# Altium project Control-Board-v4.0.PrjPcb (part 2 of 2)

## Sheet Controller-Sheet-2.SchDoc
size A4; SheetNumber: 3; SheetTotal: 5
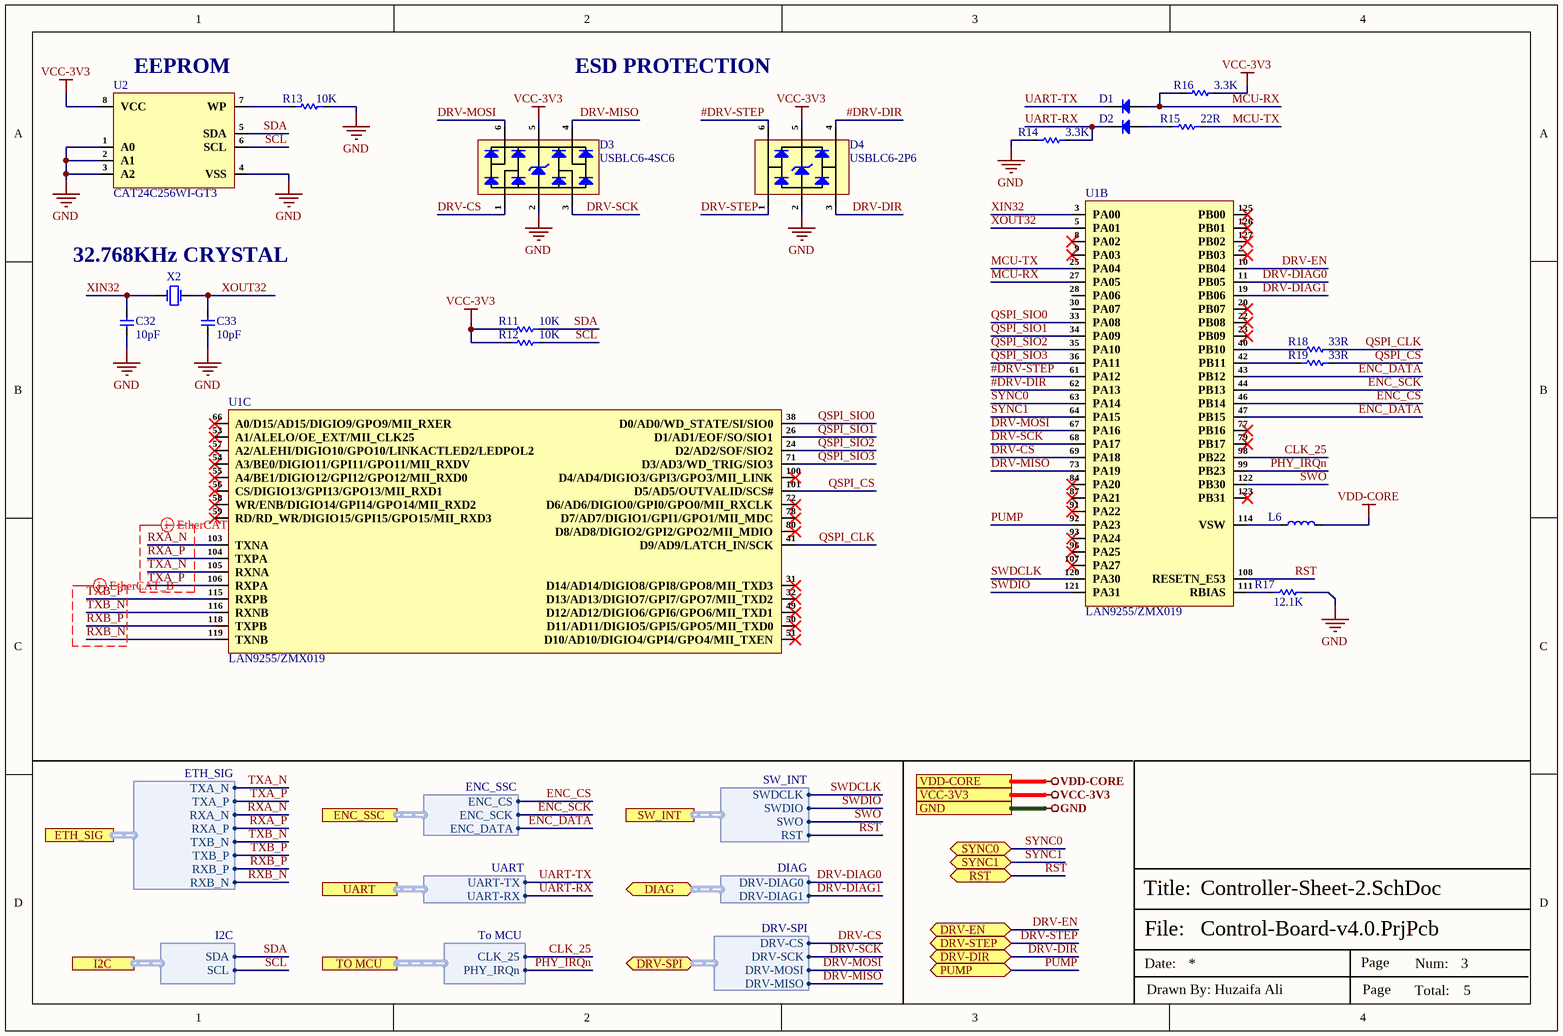
[diagram p2: Controller-Sheet-2.SchDoc]

### Parts
C32  10pF  [CAP-0201]
C33  10pF  [CAP-0201]
D1  1N4148WT  [SOD-523F]  (value not drawn)
D2  1N4148WT  [SOD-523F]  (value not drawn)
D3  USBLC6-4SC6  [SOT-23-6]
D4  USBLC6-2P6  [SOT-666]
L6  MLB1608-201P1A(f)  [IND-0603 (1608 Metric)]  (value not drawn)
R11  10K  [Res-0201]
R12  10K  [Res-0201]
R13  10K  [Res-0201]
R14  3.3K  [Res-0201]
R15  22R  [Res-0201]
R16  3.3K  [Res-0201]
R17  12.1K  [Res-0603]
R18  33R  [Res-0402]
R19  33R  [Res-0402]
U1  LAN9255/ZMX019  [LAN9255/ZMX019]  (parts B,C of 3)
U2  CAT24C256WI-GT3  [CAT24C256WI-GT3]
X2  32.768KHZ  [2-SMD, (2.00mm x 1.20mm)]  (value not drawn)

### Ports
DIAG (bidir, harness DIAG, see Top-Sheet[3B], Connector-Sheet[2D]), DRV-DIR (bidir, see Top-Sheet[3B], Connector-Sheet[1D]), DRV-EN (bidir, see Top-Sheet[3B], Connector-Sheet[1D]), DRV-SPI (bidir, harness DRV-SPI, see Top-Sheet[3B], Connector-Sheet[2D]), DRV-STEP (bidir, see Top-Sheet[3B], Connector-Sheet[1D]), ENC_SSC (harness ENC_SSC, see Top-Sheet[2B], Encoder-Sheet[1D]), ETH_SIG (harness ETH_SIG, see Top-Sheet[3B], Connector-Sheet[1D]), GND (see Top-Sheet[2A], Connector-Sheet[3D], Controller-Sheet-1[2D], Encoder-Sheet[3D]), I2C (harness I2C, see Top-Sheet[2B], Controller-Sheet-1[1D]), PUMP (bidir, see Top-Sheet[3B], Connector-Sheet[1D]), RST (bidir, see Top-Sheet[2B], Connector-Sheet[1D], Controller-Sheet-1[2D]), SW_INT (harness SW_INT, see Top-Sheet[3B], Connector-Sheet[1D]), SYNC0 (bidir, see Top-Sheet[2B], Controller-Sheet-1[2D]), SYNC1 (bidir, see Top-Sheet[2B], Controller-Sheet-1[2D]), TO MCU (harness To MCU, see Top-Sheet[2B], Controller-Sheet-1[1D]), UART (harness UART, see Top-Sheet[3B], Connector-Sheet[2D]), VCC-3V3 (see Top-Sheet[2B], Connector-Sheet[3D], Controller-Sheet-1[2D], Encoder-Sheet[2D]), VDD-CORE (see Top-Sheet[2B], Controller-Sheet-1[3D])

### Harnesses
ETH_SIG: TXA_N, TXA_P, RXA_N, RXA_P, TXB_N, TXB_P, RXB_P, RXB_N
ENC_SSC: ENC_CS, ENC_SCK, ENC_DATA
SW_INT: SWDCLK, SWDIO, SWO, RST
To MCU: CLK_25, PHY_IRQn
UART: UART-TX, UART-RX
I2C: SDA, SCL
DIAG: DRV-DIAG0, DRV-DIAG1
DRV-SPI: DRV-CS, DRV-SCK, DRV-MOSI, DRV-MISO

### Nets
GND: C32.1 C33.1 D3.2(GND) D4.2(GND) R13.2 R14.1 R17.2 U2.1(A0) U2.2(A1) U2.3(A2) U2.4(VSS) ; port GND
VCC-3V3: D3.5(VBUS) D4.5(VBUS) R11.1 R12.1 R16.2 U2.8(VCC) ; port VCC-3V3
VDD-CORE: L6.2 ; port VDD-CORE
#DRV-DIR: D4.4(I/O3) U1.62(PA13)
#DRV-STEP: D4.6(I/O4) U1.61(PA12)
CLK_25: U1.98(PB22) ; port TO MCU.CLK_25
DRV-CS: D3.1(I/O1) U1.69(PA18) ; port DRV-SPI.DRV-CS
DRV-DIAG0: U1.11(PB05) ; port DIAG.DRV-DIAG0
DRV-DIAG1: U1.19(PB06) ; port DIAG.DRV-DIAG1
DRV-DIR: D4.3(I/O2) ; port DRV-DIR
DRV-EN: U1.10(PB04) ; port DRV-EN
DRV-MISO: D3.4(I/O3) U1.73(PA19) ; port DRV-SPI.DRV-MISO
DRV-MOSI: D3.6(I/O4) U1.67(PA16) ; port DRV-SPI.DRV-MOSI
DRV-SCK: D3.3(I/O2) U1.68(PA17) ; port DRV-SPI.DRV-SCK
DRV-STEP: D4.1(I/O1) ; port DRV-STEP
ENC_CS: U1.46(PB14) ; port ENC_SSC.ENC_CS
ENC_DATA: U1.43(PB12) U1.47(PB15) ; port ENC_SSC.ENC_DATA
ENC_SCK: U1.44(PB13) ; port ENC_SSC.ENC_SCK
MCU-RX: D1.1(A) R16.1 U1.27(PA05)
MCU-TX: R15.2 U1.25(PA04)
PHY_IRQn: U1.99(PB23) ; port TO MCU.PHY_IRQn
PUMP: U1.92(PA23) ; port PUMP
QSPI_CLK: R18.2 U1.41(D9/AD9/LATCH_IN/SCK)
QSPI_CS: R19.2 U1.101(D5/AD5/OUTVALID/SCS#)
QSPI_SIO0: U1.33(PA08) U1.38(D0/AD0/WD_STATE/SI/SIO0)
QSPI_SIO1: U1.26(D1/AD1/EOF/SO/SIO1) U1.34(PA09)
QSPI_SIO2: U1.24(D2/AD2/SOF/SIO2) U1.35(PA10)
QSPI_SIO3: U1.36(PA11) U1.71(D3/AD3/WD_TRIG/SIO3)
RST: U1.108(RESETN_E53) ; port RST, port SW_INT.RST
RXA_N: U1.103(TXNA) ; port ETH_SIG.RXA_N
RXA_P: U1.104(TXPA) ; port ETH_SIG.RXA_P
RXB_N: U1.119(TXNB) ; port ETH_SIG.RXB_N
RXB_P: U1.118(TXPB) ; port ETH_SIG.RXB_P
SCL: R12.2 U2.6(SCL) ; port I2C.SCL
SDA: R11.2 U2.5(SDA) ; port I2C.SDA
SWDCLK: U1.120(PA30) ; port SW_INT.SWDCLK
SWDIO: U1.121(PA31) ; port SW_INT.SWDIO
SWO: U1.122(PB30) ; port SW_INT.SWO
SYNC0: U1.63(PA14) ; port SYNC0
SYNC1: U1.64(PA15) ; port SYNC1
TXA_N: U1.105(RXNA) ; port ETH_SIG.TXA_N
TXA_P: U1.106(RXPA) ; port ETH_SIG.TXA_P
TXB_N: U1.116(RXNB) ; port ETH_SIG.TXB_N
TXB_P: U1.115(RXPB) ; port ETH_SIG.TXB_P
UART-RX: D2.2(K) R14.2 ; port UART.UART-RX
UART-TX: D1.2(K) ; port UART.UART-TX
XIN32: C32.2 U1.3(PA00) X2.1(OSC1)
XOUT32: C33.2 U1.5(PA01) X2.2(OSC2)
NetD2_1: D2.1(A) R15.1
NetL6_1: L6.1 U1.114(VSW)
NetR13_1: R13.1 U2.7(WP)
NetR17_1: R17.1 U1.111(RBIAS)
NetR18_1: R18.1 U1.40(PB10)
NetR19_1: R19.1 U1.42(PB11)

Not connected (* = marked no-connect by the designer): U1 2(PB03)* 8(PA02)* 9(PA03)* 20(PB07)* 22(PB08)* 23(PB09)* 28(PA06) 30(PA07) 31(D14/AD14/DIGIO8/GPI8/GPO8/MII_TXD3)* 32(D13/AD13/DIGIO7/GPI7/GPO7/MII_TXD2)* 49(D12/AD12/DIGIO6/GPI6/GPO6/MII_TXD1)* 50(D11/AD11/DIGIO5/GPI5/GPO5/MII_TXD0)* 51(D10/AD10/DIGIO4/GPI4/GPO4/MII_TXEN)* 53(A1/ALELO/OE_EXT/MII_CLK25)* 54(A3/BE0/DIGIO11/GPI11/GPO11/MII_RXDV)* 55(A4/BE1/DIGIO12/GPI12/GPO12/MII_RXD0)* 56(CS/DIGIO13/GPI13/GPO13/MII_RXD1)* 57(A2/ALEHI/DIGIO10/GPO10/LINKACTLED2/LEDPOL2)* 58(WR/ENB/DIGIO14/GPI14/GPO14/MII_RXD2)* 59(RD/RD_WR/DIGIO15/GPI15/GPO15/MII_RXD3)* 66(A0/D15/AD15/DIGIO9/GPO9/MII_RXER)* 72(D6/AD6/DIGIO0/GPI0/GPO0/MII_RXCLK)* 77(PB16)* 78(D7/AD7/DIGIO1/GPI1/GPO1/MII_MDC)* 79(PB17)* 80(D8/AD8/DIGIO2/GPI2/GPO2/MII_MDIO)* 84(PA20)* 87(PA21)* 91(PA22)* 93(PA24)* 96(PA25)* 100(D4/AD4/DIGIO3/GPI3/GPO3/MII_LINK)* 107(PA27)* 123(PB31)* 125(PB00)* 126(PB01)* 127(PB02)*

### Layout directives
differential pair; differential pair class EtherCAT_B_Lines; net class EtherCAT_B; rule Matched Net Lengths [Tolerance = 25.4mil]; rule Impedance Constraint [Min = 85.00    Max = 95.00    ]: RXB_N, RXB_P, TXB_N, TXB_P
differential pair; differential pair class EtherCAT_A_Lines; net class EtherCAT_A; rule Matched Net Lengths [Tolerance = 25.4mil]; rule Impedance Constraint [Min = 85.00    Max = 95.00    ]: RXA_N, RXA_P, TXA_N, TXA_P

### Notes on the sheet
- (near U2) EEPROM
- ESD PROTECTION
- (near X2) 32.768KHz CRYSTAL
- File:
- Title:
- Date:
- Page
- Num:
- Total:
- Drawn By: Huzaifa Ali

### Library data of the parts
C32 C33 = CGA1A2C0G1E100D030BA: CAP CER 10PF 25V C0G 0201; Manufacturer: TDK; Item Type: Capacitor; Supplier 1: Digi-Key; Manufacturer Part Number: CGA1A2C0G1E100D030BA; RoHS: Yes; Category: Ceramic Capacitors; Stock 1: 28695; Pricing 1: 1=0.11000, 10=0.07900, 50=0.04340, 100=0.03540, 500=0.02530, 1000=0.01987, 2500=0.01807, 5000=0.01662 (USD); Mount: Surface Mount; Case/Package: 0201; Case Code (Imperial): 0201; Case Code (Metric): 0603; Weight: 6E-06oz; Min Operating Temperature: -55°C; Max Operating Temperature: 125°C; Packaging: Tape and Reel; Capacitance: 10pF; Voltage Rating: 25V; Termination: SMD/SMT; Voltage Rating (DC): 25V; Package Quantity: 1; Dielectric: C0G; Resistor Type: Ceramic; Series: CGA; Length: 0.6mm; Width: 0.3mm; Height: 0.3mm; Thickness: 0.013inch; Depth: 0.3mm; Ratings: AEC-Q200; RoHS Compliant: Yes; ComponentLink1URL: https://datasheet.ciiva.com/24220/cga1a2c0g1e100d030ba-271838-24220873.pdf?src-supplier=Mouser; ComponentLink1Description: https://datasheet.ciiva.com/24220/cga1a2c0g1e100d030ba-271838-24220873.pdf?src-supplier=Mouser; Supplier Part Number 1: 445-9023-1-ND; LCSC Part Number: C2168728
D1 D2 = 1N4148WT: DIODE GEN PURP 75V 200MA SOD523F; Manufacturer: ON Semiconductor / Fairchild; Recovery Time: 4ns; Forward Current: 300mA; Max Reverse Current: 5uA; Power Dissipation: 200mW; Max Forward Surge Current (Ifsm): 4A; Element Configuration: Single; Supplier 1: Future Electronics; Manufacturer Part Number: 1N4148WT; RoHS: Yes; Category: Rectifier Diodes; Stock 1: 30; Pricing 1: 1=0.0305, 20=0.0267, 125=0.0246, 750=0.0227, 4000=0.0204 (USD); Mounting Technology: Surface Mount; Pins: 2; Weight: 0.01g; Contact Plating: Tin,Matte; Min Operating Temperature: -55°C; Max Operating Temperature: 150°C; Packaging: Tape and Reel; Package Quantity: 1; Series: -; Reverse Recovery Time: 4ns; Max Repetitive Reverse Voltage (Vrrm): 75V; Average Rectified Current: 200mA; Max Reverse Voltage (DC): 75V; Reverse Recovery Time-Max: 4ns; Length: 1.3mm; Width: 0.9mm; Height: 0.7mm; Radiation Hardening: No; RoHS Compliant: Yes; Lead Free: Lead Free; Reach SVHC Compliant: No; ComponentLink1URL: https://datasheet.ciiva.com/16744/1n4148wt-16744972.pdf?src-supplier=Future+Electronics; ComponentLink1Description: https://datasheet.ciiva.com/16744/1n4148wt-16744972.pdf?src-supplier=Future+Electronics; ComponentLink2URL: https://datasheet.ciiva.com/30479/0900766b810e1cd4-30479226.pdf?src-supplier=Rs; ComponentLink2Description: https://datasheet.ciiva.com/30479/0900766b810e1cd4-30479226.pdf?src-supplier=Rs; ComponentLink3URL: https://datasheet.ciiva.com/15208/getdatasheetpartid-146392-15208359.pdf?src-supplier=Verical; ComponentLink3Description: https://datasheet.ciiva.com/15208/getdatasheetpartid-146392-15208359.pdf?src-supplier=Verical; ComponentLink4URL: https://datasheet.ciiva.com/916/1n914bwt-916865.pdf?src-supplier=Digi-Key; ComponentLink4Description: https://datasheet.ciiva.com/916/1n914bwt-916865.pdf?src-supplier=Digi-Key; ComponentLink5URL: https://datasheet.ciiva.com/916/1n914bwt-916866.pdf?src-supplier=Digi-Key; ComponentLink5Description: https://datasheet.ciiva.com/916/1n914bwt-916866.pdf?src-supplier=Digi-Key; ComponentLink6URL: https://datasheet.ciiva.com/916/1n914bwt-916864.pdf?src-supplier=Digi-Key; ComponentLink6Description: https://datasheet.ciiva.com/916/1n914bwt-916864.pdf?src-supplier=Digi-Key; Supplier Part Number 1: 6145918; LCSC Part Number: C232841; Item Type: Diode
D3 = USBLC6-4SC6: TVS DIODE 5.25VWM 17VC SOT23-6; Item Type: ESD Diode; Value: 4pF; Direction: Unidirectional; Reverse Standoff Voltage: 5V; Min Breakdown Voltage: 6V; Power Line Protection: Yes; Peak Pulse Current: 5A; Number of Elements: 1; Operating Supply Voltage: 860mV; Number of Channels: 4; Clamping Voltage: 17V; Polarity: Unidirectional,Bidirectional; Leakage Current: 150nA; Test Current: 1mA; Max Breakdown Voltage: 10V; Max Reverse Leakage Current: 2uA; LCSC Part Number: C111212; ComponentLink1Description: LCSC; Supplier: Mouser; Supplier Part Number: 511-USBLC6-4SC6; RoHS: Yes; Category: TVS Diodes; Stock: 148069; Pricing: 1=0.58, 10=0.512, 50=0.512, 100=0.381, 1000=0.271, 10000=0.211 (USD); Mounting Technology: Surface Mount; Case/Package: SOT-23; Pins: 6; Min Operating Temperature: -40°C; Max Operating Temperature: 125°C; Packaging: Tape and Reel; Series: USB; Reverse Breakdown Voltage: 6V; Breakdown Voltage: 6V; Termination: SMD/SMT; Working Voltage: 5V; ESD Protection: Yes; Voltage Rating (DC): 5V; Clamping Voltage-Max: 17V; Number of Unidirectional Channels: 4; Length: 3.05mm; Width: 1.75mm; Height: 1.3mm; Depth: 1.75mm; Radiation Hardening: No; Lead Free: Lead Free; RoHS Compliant: Yes; Reach SVHC Compliant: No; ComponentLink2URL: https://datasheet.ciiva.com/14186/usblc6-4-st-eng-tds-14186570.pdf?src-supplier=Distrelec; ComponentLink2Description: https://datasheet.ciiva.com/14186/usblc6-4-st-eng-tds-14186570.pdf?src-supplier=Distrelec; ComponentLink3URL: https://datasheet.ciiva.com/27052/1493951-27052291.pdf?src-supplier=Jameco; ComponentLink3Description: https://datasheet.ciiva.com/27052/1493951-27052291.pdf?src-supplier=Jameco; ComponentLink4URL: https://datasheet.ciiva.com/1220/48344-1220005.pdf?src-supplier=Newark; ComponentLink4Description: https://datasheet.ciiva.com/1220/48344-1220005.pdf?src-supplier=Newark; ComponentLink5URL: https://datasheet.ciiva.com/4507/cd00047494-112581-4507757.pdf?src-supplier=Mouser; ComponentLink5Description: https://datasheet.ciiva.com/4507/cd00047494-112581-4507757.pdf?src-supplier=Mouser; ComponentLink6URL: https://datasheet.ciiva.com/16206/cd00047494-16206119.pdf?src-supplier=Future+Electronics; ComponentLink6Description: https://datasheet.ciiva.com/16206/cd00047494-16206119.pdf?src-supplier=Future+Electronics; ComponentLink7URL: https://datasheet.ciiva.com/15143/getdatasheetpartid-88767-15143364.pdf?src-supplier=Verical; ComponentLink7Description: https://datasheet.ciiva.com/15143/getdatasheetpartid-88767-15143364.pdf?src-supplier=Verical; ComponentLink8URL: https://datasheet.ciiva.com/22685/1498406-22685833.pdf?src-supplier=Element14; ComponentLink8Description: https://datasheet.ciiva.com/22685/1498406-22685833.pdf?src-supplier=Element14; ComponentLink9URL: https://datasheet.ciiva.com/22692/1498406-22692454.pdf?src-supplier=Element14; ComponentLink9Description: https://datasheet.ciiva.com/22692/1498406-22692454.pdf?src-supplier=Element14
D4 = USBLC6-2P6: TVS DIODE 5.25VWM 17VC SOT666; Item Type: ESD Diode; Direction: Unidirectional,Bidirectional; Operating Supply Voltage: 5V; Number of Elements: 1; Value: 3.5pF; Reverse Breakdown Voltage: 6V; Number of Channels: 2; Clamping Voltage: 17V; Power Line Protection: Yes; Test Current: 1mA; Max Reverse Leakage Current: 150nA; Peak Pulse Current: 5A; Max Repetitive Reverse Voltage (Vrrm): 5.25V; LCSC Part Number: C15999; ComponentLink1Description: LCSC; Supplier: Mouser; Supplier Part Number: 511-USBLC6-2P6; RoHS: Yes; Category: TVS Diodes; Stock: 180020; Pricing: 1=0.59, 10=0.514, 50=0.514, 100=0.356, 1000=0.253, 10000=0.197 (USD); Mounting Technology: Surface Mount; Case/Package: SOT-666; Pins: 6; Min Operating Temperature: -40°C; Max Operating Temperature: 125°C; Package Quantity: 1; Packaging: Tape and Reel; Number of Bidirectional Channels: 2; Reverse Standoff Voltage: 5V; Min Breakdown Voltage: 6V; Polarity: Unidirectional,Bidirectional; Breakdown Voltage: 6V; Termination: SMD/SMT; Working Voltage: 5V; ESD Protection: Yes; Leakage Current: 150nA; Max Breakdown Voltage: 6V; Series: USB; Clamping Voltage-Max: 17V; Number of Unidirectional Channels: 2; Length: 1.7mm; Width: 1.3mm; Height: 0.6mm; Depth: 1.3mm; Radiation Hardening: No; Reach SVHC Compliant: No; Lead Free: Lead Free; RoHS Compliant: Yes; ComponentLink2URL: https://datasheet.ciiva.com/14186/usblc6-2-st-eng-tds-14186568.pdf?src-supplier=Distrelec; ComponentLink2Description: https://datasheet.ciiva.com/14186/usblc6-2-st-eng-tds-14186568.pdf?src-supplier=Distrelec; ComponentLink3URL: https://datasheet.ciiva.com/15143/getdatasheetpartid-98673-15143462.pdf?src-supplier=Verical; ComponentLink3Description: https://datasheet.ciiva.com/15143/getdatasheetpartid-98673-15143462.pdf?src-supplier=Verical; ComponentLink4URL: https://datasheet.ciiva.com/22685/1690354-22685832.pdf?src-supplier=Element14; ComponentLink4Description: https://datasheet.ciiva.com/22685/1690354-22685832.pdf?src-supplier=Element14; ComponentLink5URL: https://datasheet.ciiva.com/22692/1690354-22692453.pdf?src-supplier=Element14; ComponentLink5Description: https://datasheet.ciiva.com/22692/1690354-22692453.pdf?src-supplier=Element14; ComponentLink6URL: https://datasheet.ciiva.com/4508/cd00050750-4508892.pdf?src-supplier=Mouser; ComponentLink6Description: https://datasheet.ciiva.com/4508/cd00050750-4508892.pdf?src-supplier=Mouser; ComponentLink7URL: https://datasheet.ciiva.com/16378/cd00050750-16378714.pdf?src-supplier=Future+Electronics; ComponentLink7Description: https://datasheet.ciiva.com/16378/cd00050750-16378714.pdf?src-supplier=Future+Electronics; ComponentLink8URL: https://datasheet.ciiva.com/41444/001184108-da-01-en-ic-esd-protection-usblc6-2p6-sot-666-stm-41444134.pdf?src-supplier=Conrad; ComponentLink8Description: https://datasheet.ciiva.com/41444/001184108-da-01-en-ic-esd-protection-usblc6-2p6-sot-666-stm-41444134.pdf?src-supplier=Conrad
L6 = MLB1608-201P1A(f): 200Ω @ 100MHz 1 1A 300mΩ 0603 Ferrite Beads; Manufacturer: Meled; Number of Lines: 1; Impedance @ Frequency: 200Ω @ 100MHz; Current Rating (Max): 1A; DC Resistance (DCR) (Max): 300mΩ; ComponentLink1Description: LCSC; ComponentLink1URL: https://www.lcsc.com/product-detail/Ferrite-Beads_Meled-MLB1608-201P1A-f_C45316.html
R11-R13 = RC0201FR-0710KL: RES SMD 10K OHM 1% 1/20W 0201; Manufacturer: Yageo; Item Type: Resistor; Manufacturer Part Number: RC0201FR-0710KL; Package: 0201; ComponentLink7Description: LCSC; ComponentLink7URL: https://www.lcsc.com/product-detail/Chip-Resistor-Surface-Mount_YAGEO-RC0201FR-0710KL_C106225.html; LCSC Part Number: C106225
R14 R16 = RC0201FR-073K3L: RES 3.3K OHM 1% 1/20W 0201; Manufacturer: Yageo; Item Type: Resistor; Supplier: Future Electronics; Supplier Part Number: 1068525; Manufacturer Part Number: RC0201FR-073K3L; RoHS: Yes; Category: Chip SMD Resistors; Stock: 40000; Pricing: 10000=0.0009, 50000=0.0013, 100000=0.0008, 250000=0.0013, 400000=0.0008, 750000=0.0012, 1500000=0.0007, 2000000=0.0011, 5000000=0.0007 (USD); ComponentLink1URL: https://datasheet.ciiva.com/14985/pyu-r-int-thick-7-14985418.pdf?src-supplier=Digi-Key; ComponentLink1Description: https://datasheet.ciiva.com/14985/pyu-r-int-thick-7-14985418.pdf?src-supplier=Digi-Key; ComponentLink2URL: https://datasheet.ciiva.com/22698/1563626-22698524.pdf?src-supplier=Element14; ComponentLink2Description: https://datasheet.ciiva.com/22698/1563626-22698524.pdf?src-supplier=Element14; LCSC Part Number: C274874
R15 = RC0201FR-0722RL: RES 22 OHM 1% 1/20W 0201; Manufacturer: Yageo; Item Type: Resistor; Supplier: Future Electronics; Supplier Part Number: 5973409; Manufacturer Part Number: RC0201FR-0722RL; RoHS: Yes; Category: Chip SMD Resistors; Stock: 17980000; Pricing: 10000=0.0014, 50000=0.0013, 250000=0.0013, 750000=0.0012, 2000000=0.0011 (USD); ComponentLink1URL: https://datasheet.ciiva.com/7672/1563626-7672215.pdf?src-supplier=Element14; ComponentLink1Description: https://datasheet.ciiva.com/7672/1563626-7672215.pdf?src-supplier=Element14; LCSC Part Number: C155743
R17 = RT0603CRD0712K1L: RES SMD 12.1K OHM 1/10W 0603; Manufacturer: Yageo; Resistance: 12.1kR; Tolerance: 0.25%; Temperature Coefficient: 25ppm/°C; Power Rating: 100mW; Voltage Rating: 75V; Voltage Rating (DC): 50V; Supplier 1: Digi-Key; Manufacturer Part Number: RT0603CRD0712K1L; RoHS: Yes; Category: Chip SMD Resistors; Pricing 1: 5000=0.06299 (USD); Case/Package: 0603; Contact Plating: Tin,Matte; Case Code (Metric): 1608; Case Code (Imperial): 0603; Min Operating Temperature: -55°C; Max Operating Temperature: 125°C; Resistor Type: Thin Film; Package Quantity: 5000; Packaging: Tape and Reel; Number of Terminations: 2; Termination: SMD/SMT; Max Power Dissipation: 100mW; Series: RT; Length: 0.063inch; Width: 0.031inch; Height: 0.022inch; Radiation Hardening: No; Lead Free: Lead Free; RoHS Compliant: Yes; ComponentLink1URL: https://datasheet.ciiva.com/2590/pyu-rt-1-to-0-05-rohs-l-5-2590806.pdf?src-supplier=Digi-Key; ComponentLink1Description: https://datasheet.ciiva.com/2590/pyu-rt-1-to-0-05-rohs-l-5-2590806.pdf?src-supplier=Digi-Key; ComponentLink2URL: https://datasheet.ciiva.com/8891/pyu-rt-1-to-0-05-rohs-l-4-8891049.pdf?src-supplier=Avnet; ComponentLink2Description: https://datasheet.ciiva.com/8891/pyu-rt-1-to-0-05-rohs-l-4-8891049.pdf?src-supplier=Avnet; ComponentLink3URL: https://datasheet.ciiva.com/12721/pyu-rt-1-to-0-05-rohs-l-4-12721018.pdf?src-supplier=Mouser; ComponentLink3Description: https://datasheet.ciiva.com/12721/pyu-rt-1-to-0-05-rohs-l-4-12721018.pdf?src-supplier=Mouser; Supplier Part Number 1: RT0603CRD0712K1L-ND; LCSC Part Number: C705893
R18 R19 = RC0402FR-0733RL: RES 33 OHM 1% 1/16W 0402; Manufacturer: Yageo; Power Rating: 62.5mW; Voltage Rating: 50V; Temperature Coefficient: 100ppm/°C; Max Power Dissipation: 63mW; Supplier 1: Mouser; Manufacturer Part Number: RC0402FR-0733RL; RoHS: Yes; Category: Chip SMD Resistors; Stock 1: 1843488; Pricing 1: 1=0.10000, 10=0.01200, 50=0.01200, 100=0.00500, 1000=0.00300, 10000=0.00100 (USD); Case/Package: 0402; Number of Pins: 2; Case Code (Imperial): 0402; Case Code (Metric): 1005; Size Code: 0402; Min Operating Temperature: -55°C; Max Operating Temperature: 155°C; Resistor Type: Thick Film; Resistance: 33R; Tolerance: 1%; Packaging: Tape and Reel; Voltage Rating (DC): 50V; Package Quantity: 10000; Termination: SMD/SMT; Features: Moisture Resistant; Series: RC; Number of Terminations: 2; Resistance Tolerance: 1%; Construction: Rectangular; Technology: THICK FILM; Length: 1mm; Width: 0.5mm; Height: 0.35mm; Depth: 0.5mm; RoHS Compliant: Yes; REACH SVHC: Unknown; Military Standard: Not; Lead Free: Lead Free; ComponentLink1URL: https://datasheet.ciiva.com/11819/0900766b80c66297-11819487.pdf?src-supplier=RSComponents; ComponentLink1Description: https://datasheet.ciiva.com/11819/0900766b80c66297-11819487.pdf?src-supplier=RSComponents; ComponentLink2URL: https://datasheet.ciiva.com/24070/pyu-rc0402-51-rohs-l-6-r-8721-24070077.pdf?src-supplier=Mouser; ComponentLink2Description: https://datasheet.ciiva.com/24070/pyu-rc0402-51-rohs-l-6-r-8721-24070077.pdf?src-supplier=Mouser; ComponentLink3URL: https://datasheet.ciiva.com/7849/1018594-7849967.pdf?src-supplier=Element14; ComponentLink3Description: https://datasheet.ciiva.com/7849/1018594-7849967.pdf?src-supplier=Element14; ComponentLink4URL: https://datasheet.ciiva.com/7849/1018594-7849966.pdf?src-supplier=Element14; ComponentLink4Description: https://datasheet.ciiva.com/7849/1018594-7849966.pdf?src-supplier=Element14; ComponentLink5URL: https://datasheet.ciiva.com/15189/getdatasheetpartid-329253-15189431.pdf?src-supplier=Verical; ComponentLink5Description: https://datasheet.ciiva.com/15189/getdatasheetpartid-329253-15189431.pdf?src-supplier=Verical; ComponentLink6URL: https://datasheet.ciiva.com/17070/pyu-rc0402-51-rohs-l-6-r-17070335.pdf?src-supplier=Future+Electronics; ComponentLink6Description: https://datasheet.ciiva.com/17070/pyu-rc0402-51-rohs-l-6-r-17070335.pdf?src-supplier=Future+Electronics; Supplier Part Number 1: 603-RC0402FR-0733RL; LCSC Part Number: C138002
U1 = LAN9255/ZMX019: IC ETHERCAT SLAVE CONTROLLER; Manufacturer: Microchip; Manufacturer Part Number: LAN9255-I/ZMX019; Supplier 1: Digi-Key; Stock 1: 70; Pricing 1: 1=17.76000, 25=16.18480 (USD); Supplier Part Number 1: 150-LAN9255-I/ZMX019-ND
U2 = CAT24C256WI-GT3: IC EEPROM 256KBIT I2C 1MHZ 8SOIC; Manufacturer: ON Semiconductor; Interface: I2C,Serial,2-Wire; Access Time: 900ns; Max Supply Voltage: 5.5V; Min Supply Voltage: 1.8V; Frequency: 400kHz; Memory Size: 256Kb; Number of Words: 32000; Operating Supply Voltage: 5V; Nominal Supply Current: 3mA; Write Cycle Time-Max (tWC): 5ms; Write Protection: YES; Organization: 32KX8; Supplier 1: RSComponents; Manufacturer Part Number: CAT24C256WI-GT3; RoHS: Yes; Category: EEPROM; Stock 1: 300; Pricing 1: 100=0.19900, 200=0.19400, 500=0.18900, 1000=0.18400 (GBP); Mount: Surface Mount; Case/Package: SOIC; Number of Pins: 8; Contact Plating: Gold; Min Operating Temperature: -40°C; Max Operating Temperature: 85°C; Packaging: Tape and Reel; Density: 256Kb; Package Quantity: 1; Memory Type: EEPROM; Max Frequency: 400kHz; Series: -; Supply Voltage-Nom: 5.5V; Access Time-Max: 900ns; Supply Current: 3mA; Length: 5mm; Width: 4mm; Height: 1.5mm; Radiation Hardening: No; Lead Free: Lead Free; Halogen Free: Halogen Free; REACH SVHC: No SVHC; RoHS Compliant: Yes; ComponentLink1URL: https://datasheet.ciiva.com/8072/1780696-8072142.pdf?src-supplier=Element14; ComponentLink1Description: https://datasheet.ciiva.com/8072/1780696-8072142.pdf?src-supplier=Element14; ComponentLink2URL: https://datasheet.ciiva.com/46391/1792913-46391371.pdf?src-supplier=Element14; ComponentLink2Description: https://datasheet.ciiva.com/46391/1792913-46391371.pdf?src-supplier=Element14; ComponentLink3URL: https://datasheet.ciiva.com/4859/cat24c256-d-105771-4859816.pdf?src-supplier=Mouser; ComponentLink3Description: https://datasheet.ciiva.com/4859/cat24c256-d-105771-4859816.pdf?src-supplier=Mouser; ComponentLink4URL: https://datasheet.ciiva.com/16427/cat24c256-d-16427973.pdf?src-supplier=Future+Electronics; ComponentLink4Description: https://datasheet.ciiva.com/16427/cat24c256-d-16427973.pdf?src-supplier=Future+Electronics; Supplier Part Number 1: 8080199P
X2 = CM8V-T1A-32.768KHZ-6PF-20PPM-TA-QC: Crystal 32.768KHZ 6.0PF SMD; Manufacturer: Micro Crystal; Supplier 1: Digi-Key; Manufacturer Part Number: CM8V-T1A-32.768KHZ-6PF-20PPM-TA-QC; RoHS: No; Stock 1: 21000; Pricing 1: 1=0.68000, 10=0.56400, 50=0.50740, 100=0.45100, 500=0.42844 (USD); Supplier Part Number 1: 2195-CM8V-T1A-32.768KHZ-6PF-20PPM-TA-QCCT-ND

## Sheet Encoder-Sheet.SchDoc
size A4; SheetNumber: 4; SheetTotal: 5
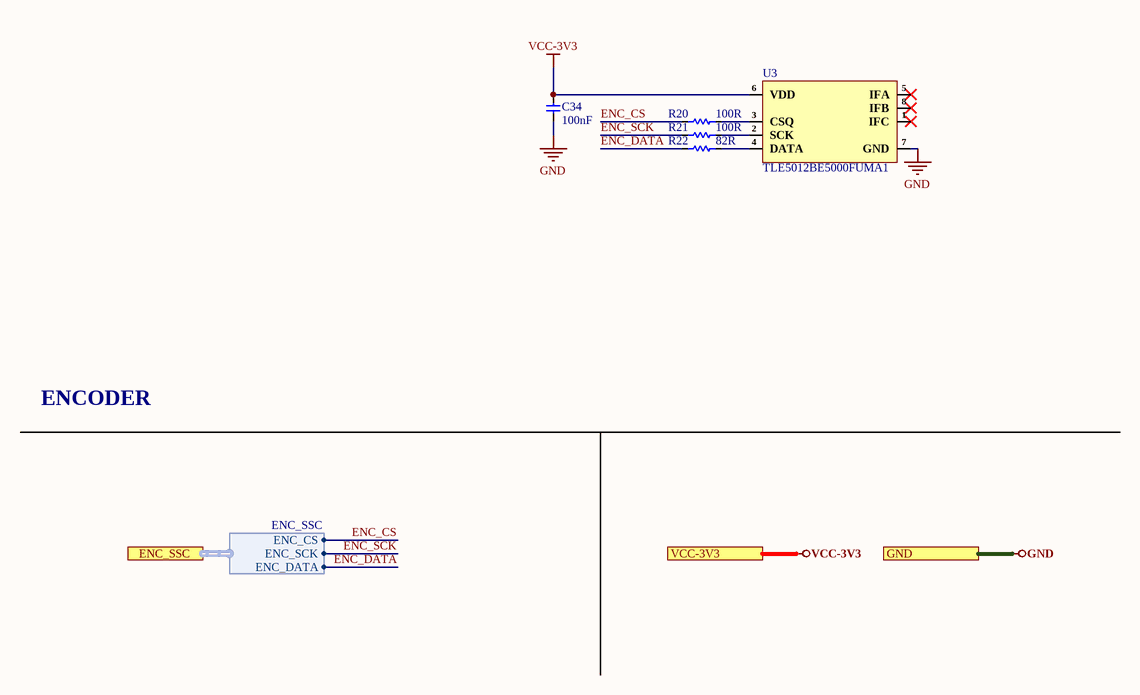
[diagram p3: Encoder-Sheet.SchDoc]

### Parts
C34  100nF  [CAP-0201]
R20  100R  [Res-0201]
R21  100R  [Res-0201]
R22  82R  [Res-0201]
U3  TLE5012BE5000FUMA1  [TLE5012BE5000FUMA1]

### Ports
ENC_SSC (harness ENC_SSC, see Top-Sheet[2C], Controller-Sheet-2[1D]), GND (see Top-Sheet[1C], Connector-Sheet[3D], Controller-Sheet-1[2D], Controller-Sheet-2[3D]), VCC-3V3 (see Top-Sheet[1C], Connector-Sheet[3D], Controller-Sheet-1[2D], Controller-Sheet-2[3D])

### Harnesses
ENC_SSC: ENC_CS, ENC_SCK, ENC_DATA

### Nets
GND: C34.1 U3.7(GND) ; port GND
VCC-3V3: C34.2 U3.6(VDD) ; port VCC-3V3
ENC_CS: R20.1 ; port ENC_SSC.ENC_CS
ENC_DATA: R22.1 ; port ENC_SSC.ENC_DATA
ENC_SCK: R21.1 ; port ENC_SSC.ENC_SCK
NetR20_2: R20.2 U3.3(CSQ)
NetR21_2: R21.2 U3.2(SCK)
NetR22_2: R22.2 U3.4(DATA)

Not connected (* = marked no-connect by the designer): U3 1(IFC)* 5(IFA)* 8(IFB)*

### Notes on the sheet
- ENCODER
- File:
- Title:
- Date:
- Page
- Num:
- Total:
- Drawn By: Huzaifa Ali

### Library data of the parts
C34 = CC0201KRX5R6BB104: CAP CER 0.1UF 10V X5R 0201; Manufacturer: Yageo; Tolerance: 10%; Supplier 1: Mouser; Manufacturer Part Number: CC0201KRX5R6BB104; RoHS: Yes; Category: Ceramic Capacitors; Stock 1: 824403; Pricing 1: 1=0.10000, 10=0.02400, 50=0.02400, 100=0.01900, 1000=0.01100, 10000=0.00900 (USD); Mount: Surface Mount; Case/Package: 0201; Case Code (Imperial): 0201; Case Code (Metric): 0603; Weight: 6E-06oz; Min Operating Temperature: -55°C; Max Operating Temperature: 85°C; Capacitance: 100nF; Dielectric: X5R; Voltage Rating (DC): 10V; Packaging: Tape and Reel; Termination: SMD/SMT; Resistor Type: Ceramic; Voltage Rating: 10V; Series: CC; Construction: Flat; Length: 0.6mm; Width: 0.012inch; Height: 0.3mm; Thickness: 0.013inch; Depth: 0.3mm; Radiation Hardening: No; Lead Free: Lead Free; Halogen Free: Halogen Free; RoHS Compliant: Yes; ComponentLink1URL: https://datasheet.ciiva.com/11587/upy-gphc-x5r-4v-to-50v-12-11587190.pdf?src-supplier=Avnet; ComponentLink1Description: https://datasheet.ciiva.com/11587/upy-gphc-x5r-4v-to-50v-12-11587190.pdf?src-supplier=Avnet; Supplier Part Number 1: 603-CC201KRX5R6BB104; LCSC Part Number: C190183
R20 R21 = RC0201FR-07100RL: RES 100 OHM Thick Film 0201 1% 1/20W ±200ppm/°C Molded SMD SMD Paper T/R; Manufacturer: Yageo; Power Rating: 50mW; Voltage Rating: 25V; Item Type: Resistor; Supplier: Digi-Key; Supplier Part Number: 311-100MCT-ND; Manufacturer Part Number: RC0201FR-07100RL; RoHS: Yes; Category: Chip SMD Resistors; Stock: 193246; Pricing: 1=0.1, 10=0.027, 50=0.0172, 100=0.0143, 500=0.00988, 1000=0.00854, 5000=0.00629 (USD); Case/Package: 0201; Contact Plating: Tin,Matte; Case Code (Metric): 0603; Package: 0201; Min Operating Temperature: -55°C; Max Operating Temperature: 125°C; Value: 100R; Tolerance: 1%; Resistor Type: Thick Film; Temperature Coefficient: 200ppm/°C; Packaging: Cut Tape; Package Quantity: 1; Number of Terminations: 2; Termination: SMD/SMT; Max Power Dissipation: 50mW; Features: Moisture Resistant; Series: RC; Resistance Tolerance: 1%; Length: 0.024inch; Width: 0.012inch; Height: 0.01inch; Lead Free: Lead Free; RoHS Compliant: Yes; Reach SVHC Compliant: Unknown; ComponentLink1URL: https://datasheet.ciiva.com/2560/pyu-r-int-thick-7-2560866.pdf?src-supplier=Digi-Key; ComponentLink1Description: https://datasheet.ciiva.com/2560/pyu-r-int-thick-7-2560866.pdf?src-supplier=Digi-Key; ComponentLink2URL: https://datasheet.ciiva.com/2560/pyu-r-int-thick-7-2560867.pdf?src-supplier=Digi-Key; ComponentLink2Description: https://datasheet.ciiva.com/2560/pyu-r-int-thick-7-2560867.pdf?src-supplier=Digi-Key; ComponentLink3URL: https://datasheet.ciiva.com/2560/pyu-r-int-thick-7-2560865.pdf?src-supplier=Digi-Key; ComponentLink3Description: https://datasheet.ciiva.com/2560/pyu-r-int-thick-7-2560865.pdf?src-supplier=Digi-Key; ComponentLink4URL: https://datasheet.ciiva.com/8887/pyu-rc0201-51-rohs-l-8-8887865.pdf?src-supplier=Avnet; ComponentLink4Description: https://datasheet.ciiva.com/8887/pyu-rc0201-51-rohs-l-8-8887865.pdf?src-supplier=Avnet; LCSC Part Number: C77623; ComponentLink5Description: LCSC; ComponentLink5URL: https://www.lcsc.com/product-detail/Chip-Resistor-Surface-Mount_YAGEO-RC0201FR-07100RL_C77623.html
R22 = RC0201FR-0782RL: RES 82 OHM 0201 Thick Film 1% 0.05W(1/20W) ±200ppm/C Pad SMD T/R; Manufacturer: Yageo; Power Rating: 50mW; Voltage Rating: 25V; Temperature Coefficient: 200ppm/°C; Item Type: Resistor; Supplier: Digi-Key; Supplier Part Number: YAG2818CT-ND; Manufacturer Part Number: RC0201FR-0782RL; RoHS: Yes; Category: Chip SMD Resistors; Stock: 59484; Pricing: 1=0.1, 10=0.027, 50=0.0172, 100=0.0143, 500=0.00988, 1000=0.00854, 5000=0.00629 (USD); Case/Package: 0201; Case Code (Imperial): 0201; Case Code (Metric): 0603; Min Operating Temperature: -55°C; Max Operating Temperature: 125°C; Tolerance: 1%; Value: 82R; Packaging: Tape and Reel; Resistor Type: Thick Film; Number of Terminations: 2; Termination: SMD/SMT; Max Power Dissipation: 50mW; Working Voltage: 25V; Features: Moisture Resistant; Series: RC; Resistance Tolerance: 1%; Technology: THICK FILM; Length: 0.6mm; Width: 0.3mm; Height: 0.23mm; Reach SVHC Compliant: No; Lead Free: Lead Free; RoHS Compliant: Yes; ComponentLink1URL: https://datasheet.ciiva.com/22661/1563626-22661339.pdf?src-supplier=Element14; ComponentLink1Description: https://datasheet.ciiva.com/22661/1563626-22661339.pdf?src-supplier=Element14; LCSC Part Number: C273281; ComponentLink2Description: LCSC; ComponentLink2URL: https://www.lcsc.com/product-detail/Chip-Resistor-Surface-Mount_YAGEO-RC0201FR-0782RL_C273281.html
U3 = TLE5012BE5000FUMA1: MAGNETIC ANGLE SENSOR; Manufacturer: Infineon; Interface: SPI,PWM; Supplier 1: RSComponents; Manufacturer Part Number: TLE5012BE5000; RoHS: Yes; Category: Magnetic Sensors; Number of Pins: 8; Series: TLE5012; Package Quantity: 2500; Packaging: Tape and Reel; RoHS Compliant: Yes; ComponentLink1URL: http://www.mouser.com/ds/2/196/Infineon-TLE5012B_Exxxx-DS-v02_00-en-540142.pdf?src-supplier=Mouser; ComponentLink1Description: http://www.mouser.com/ds/2/196/Infineon-TLE5012B_Exxxx-DS-v02_00-en-540142.pdf?src-supplier=Mouser; Supplier Part Number 1: 2238590

## Sheet Connector-Sheet.SchDoc
size A4; SheetNumber: 5; SheetTotal: 5
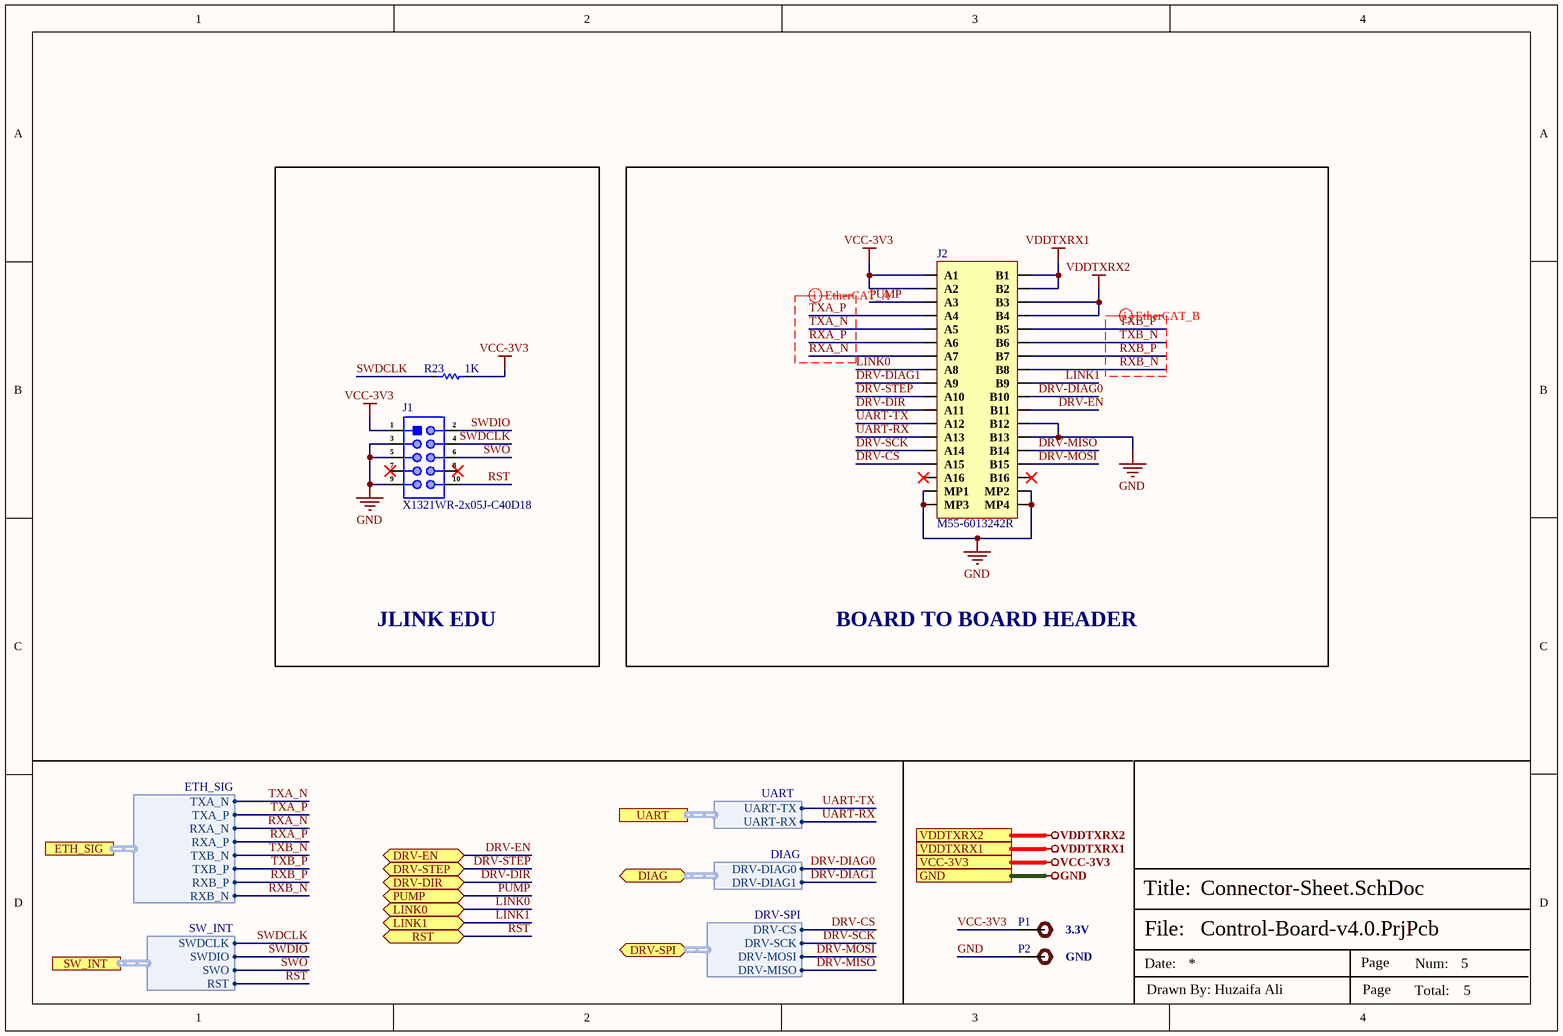
[diagram p4: Connector-Sheet.SchDoc]

### Parts
J1  X1321WR-2x05J-C40D18  [X1321WR-2x05J-C40D18]
J2  M55-6013242R  [M55-6013242R]
P1  TEST POINT  [Test-point]  (value not drawn)
P2  TEST POINT  [Test-point]  (value not drawn)
R23  1K  [Res-0201]

### Blocks framed on the sheet
JLINK EDU: J1 R23
BOARD TO BOARD HEADER: J2

### Ports
DIAG (bidir, harness DIAG, see Top-Sheet[3B], Controller-Sheet-2[2D]), DRV-DIR (bidir, see Top-Sheet[3B], Controller-Sheet-2[3D]), DRV-EN (bidir, see Top-Sheet[3B], Controller-Sheet-2[3D]), DRV-SPI (bidir, harness DRV-SPI, see Top-Sheet[3B], Controller-Sheet-2[2D]), DRV-STEP (bidir, see Top-Sheet[3B], Controller-Sheet-2[3D]), ETH_SIG (harness ETH_SIG, see Top-Sheet[3B], Controller-Sheet-2[1D]), GND (see Top-Sheet[3A], Controller-Sheet-1[2D], Controller-Sheet-2[3D], Encoder-Sheet[3D]), LINK0 (bidir, see Top-Sheet[3C], Controller-Sheet-1[3D]), LINK1 (bidir, see Top-Sheet[3C], Controller-Sheet-1[3D]), PUMP (bidir, see Top-Sheet[3B], Controller-Sheet-2[3D]), RST (bidir, see Top-Sheet[3B], Controller-Sheet-1[2D], Controller-Sheet-2[3D]), SW_INT (harness SW_INT, see Top-Sheet[3B], Controller-Sheet-2[2D]), UART (harness UART, see Top-Sheet[3B], Controller-Sheet-2[1D]), VCC-3V3 (see Top-Sheet[3B], Controller-Sheet-1[2D], Controller-Sheet-2[3D], Encoder-Sheet[2D]), VDDTXRX1 (see Top-Sheet[3B], Controller-Sheet-1[3D]), VDDTXRX2 (see Top-Sheet[3B], Controller-Sheet-1[3D])

### Harnesses
DIAG: DRV-DIAG0, DRV-DIAG1
DRV-SPI: DRV-CS, DRV-SCK, DRV-MOSI, DRV-MISO
UART: UART-TX, UART-RX
SW_INT: SWDCLK, SWDIO, SWO, RST
ETH_SIG: TXA_N, TXA_P, RXA_N, RXA_P, TXB_N, TXB_P, RXB_P, RXB_N

### Nets
GND: J1.3 J1.5 J1.9 J2.B12 J2.B13 J2.MP1 J2.MP2 J2.MP3 J2.MP4 P2.1 ; port GND
VCC-3V3: J1.1 J2.A1 J2.A2 P1.1 R23.2 ; port VCC-3V3
VDDTXRX1: J2.B1 J2.B2 ; port VDDTXRX1
VDDTXRX2: J2.B3 J2.B4 ; port VDDTXRX2
DRV-CS: J2.A15 ; port DRV-SPI.DRV-CS
DRV-DIAG0: J2.B10 ; port DIAG.DRV-DIAG0
DRV-DIAG1: J2.A9 ; port DIAG.DRV-DIAG1
DRV-DIR: J2.A11 ; port DRV-DIR
DRV-EN: J2.B11 ; port DRV-EN
DRV-MISO: J2.B14 ; port DRV-SPI.DRV-MISO
DRV-MOSI: J2.B15 ; port DRV-SPI.DRV-MOSI
DRV-SCK: J2.A14 ; port DRV-SPI.DRV-SCK
DRV-STEP: J2.A10 ; port DRV-STEP
LINK0: J2.A8 ; port LINK0
LINK1: J2.B9 ; port LINK1
PUMP: J2.A3 ; port PUMP
RST: J1.10 ; port RST, port SW_INT.RST
RXA_N: J2.A7 ; port ETH_SIG.RXA_N
RXA_P: J2.A6 ; port ETH_SIG.RXA_P
RXB_N: J2.B8 ; port ETH_SIG.RXB_N
RXB_P: J2.B7 ; port ETH_SIG.RXB_P
SWDCLK: J1.4 R23.1 ; port SW_INT.SWDCLK
SWDIO: J1.2 ; port SW_INT.SWDIO
SWO: J1.6 ; port SW_INT.SWO
TXA_N: J2.A5 ; port ETH_SIG.TXA_N
TXA_P: J2.A4 ; port ETH_SIG.TXA_P
TXB_N: J2.B6 ; port ETH_SIG.TXB_N
TXB_P: J2.B5 ; port ETH_SIG.TXB_P
UART-RX: J2.A13 ; port UART.UART-RX
UART-TX: J2.A12 ; port UART.UART-TX

Not connected (* = marked no-connect by the designer): J1 7* 8*; J2 A16* B16*

### Layout directives
differential pair; differential pair class EtherCAT_A_Lines; net class EtherCAT_A; rule Matched Net Lengths [Tolerance = 25.4mil]; rule Impedance Constraint [Min = 85.00    Max = 95.00    ]: RXA_N, RXA_P, TXA_N, TXA_P
differential pair; differential pair class EtherCAT_B_Lines; net class EtherCAT_B; rule Matched Net Lengths [Tolerance = 25.4mil]; rule Impedance Constraint [Min = 85.00    Max = 95.00    ]: RXB_N, RXB_P, TXB_N, TXB_P

### Notes on the sheet
- 3.3V
- GND
- File:
- Title:
- Date:
- Page
- Num:
- Total:
- Drawn By: Huzaifa Ali

### Library data of the parts
J1 = X1321WR-2x05J-C40D18: Gold 250V 1A Right-Angle Square Pins 1mm 10P 260℃ 4mm -40℃~+105℃ 1.27mm 双排 Black Brass 1.27mm 2x5P Push-Pull,P=1.27mm Pin Headers ROHS; Manufacturer: XKB; Item Type: Male Pin Header; Manufacturer Part Number: X1321WR-2x05J-C40D18; Package: Push-Pull,P=1.27mm; LCSC Part Number: C2881825; ComponentLink1Description: LCSC
J2 = M55-6013242R: CONN RCPT 1.27MM SMD 32POS; Manufacturer: Harwin; Item Type: Receptacle Connector; Supplier: Mouser; Supplier Part Number: 855-M55-6013242R; Manufacturer Part Number: M55-6013242R; RoHS: Yes; Category: Connectors; Stock: 3210; Pricing: 1=3.74, 10=3.21, 50=3.21, 100=2.99, 1000=2.11, 10000=2.01 (USD)
P1 P2 = TEST POINT: Test Point ON; Item Type: TEST POINT
R23 = RC0201FR-071KP: RES 1K OHM 1% 1/20W 0201; Manufacturer: Yageo; Supplier 1: Digi-Key; Manufacturer Part Number: RC0201FR-071KP; RoHS: Yes; Stock 1: 4800; Pricing 1: 1=0.11000, 10=0.10200, 100=0.03940, 1000=0.01734, 2500=0.01497, 5000=0.01340 (USD); RoHS Compliant: Yes; Supplier Part Number 1: 13-RC0201FR-071KPCT-ND; LCSC Part Number: C3953443

## Nets that join several sheets
GND: Controller-Sheet-1 (42 pins), Controller-Sheet-2 (11 pins), Encoder-Sheet (C34.1 U3.7), Connector-Sheet (10 pins)
VCC-3V3: Controller-Sheet-1 (33 pins), Controller-Sheet-2 (6 pins), Encoder-Sheet (C34.2 U3.6), Connector-Sheet (5 pins)
VDD-CORE: Controller-Sheet-1 (C30.1 C31.1 U1.109), Controller-Sheet-2 (L6.2)
VDDTXRX1: Controller-Sheet-1 (C6.1 C7.1 L2.2 U1.102), Connector-Sheet (J2.B1 J2.B2)
VDDTXRX2: Controller-Sheet-1 (C8.1 C9.1 L3.2 U1.124), Connector-Sheet (J2.B3 J2.B4)
CLK_25: Controller-Sheet-1 (R10.2), Controller-Sheet-2 (U1.98)
DRV-CS: Controller-Sheet-2 (D3.1 U1.69), Connector-Sheet (J2.A15)
DRV-DIAG0: Controller-Sheet-2 (U1.11), Connector-Sheet (J2.B10)
DRV-DIAG1: Controller-Sheet-2 (U1.19), Connector-Sheet (J2.A9)
DRV-DIR: Controller-Sheet-2 (D4.3), Connector-Sheet (J2.A11)
DRV-EN: Controller-Sheet-2 (U1.10), Connector-Sheet (J2.B11)
DRV-MISO: Controller-Sheet-2 (D3.4 U1.73), Connector-Sheet (J2.B14)
DRV-MOSI: Controller-Sheet-2 (D3.6 U1.67), Connector-Sheet (J2.B15)
DRV-SCK: Controller-Sheet-2 (D3.3 U1.68), Connector-Sheet (J2.A14)
DRV-STEP: Controller-Sheet-2 (D4.1), Connector-Sheet (J2.A10)
ENC_CS: Controller-Sheet-2 (U1.46), Encoder-Sheet (R20.1)
ENC_DATA: Controller-Sheet-2 (U1.43 U1.47), Encoder-Sheet (R22.1)
ENC_SCK: Controller-Sheet-2 (U1.44), Encoder-Sheet (R21.1)
LINK0: Controller-Sheet-1 (R8.1 U1.95), Connector-Sheet (J2.A8)
LINK1: Controller-Sheet-1 (R7.1 U1.90), Connector-Sheet (J2.B9)
PHY_IRQn: Controller-Sheet-1 (R2.1 U1.88), Controller-Sheet-2 (U1.99)
PUMP: Controller-Sheet-2 (U1.92), Connector-Sheet (J2.A3)
RST: Controller-Sheet-1 (5 pins), Controller-Sheet-2 (U1.108), Connector-Sheet (J1.10)
RXA_N: Controller-Sheet-2 (U1.103), Connector-Sheet (J2.A7)
RXA_P: Controller-Sheet-2 (U1.104), Connector-Sheet (J2.A6)
RXB_N: Controller-Sheet-2 (U1.119), Connector-Sheet (J2.B8)
RXB_P: Controller-Sheet-2 (U1.118), Connector-Sheet (J2.B7)
SCL: Controller-Sheet-1 (U1.83), Controller-Sheet-2 (R12.2 U2.6)
SDA: Controller-Sheet-1 (U1.82), Controller-Sheet-2 (R11.2 U2.5)
SWDCLK: Controller-Sheet-2 (U1.120), Connector-Sheet (J1.4 R23.1)
SWDIO: Controller-Sheet-2 (U1.121), Connector-Sheet (J1.2)
SWO: Controller-Sheet-2 (U1.122), Connector-Sheet (J1.6)
SYNC0: Controller-Sheet-1 (U1.70), Controller-Sheet-2 (U1.63)
SYNC1: Controller-Sheet-1 (U1.39), Controller-Sheet-2 (U1.64)
TXA_N: Controller-Sheet-2 (U1.105), Connector-Sheet (J2.A5)
TXA_P: Controller-Sheet-2 (U1.106), Connector-Sheet (J2.A4)
TXB_N: Controller-Sheet-2 (U1.116), Connector-Sheet (J2.B6)
TXB_P: Controller-Sheet-2 (U1.115), Connector-Sheet (J2.B5)
UART-RX: Controller-Sheet-2 (D2.2 R14.2), Connector-Sheet (J2.A13)
UART-TX: Controller-Sheet-2 (D1.2), Connector-Sheet (J2.A12)